# Altium schematic sheet 04_microSD.SchDoc
size A4; SheetNumber: 5; SheetTotal: 6
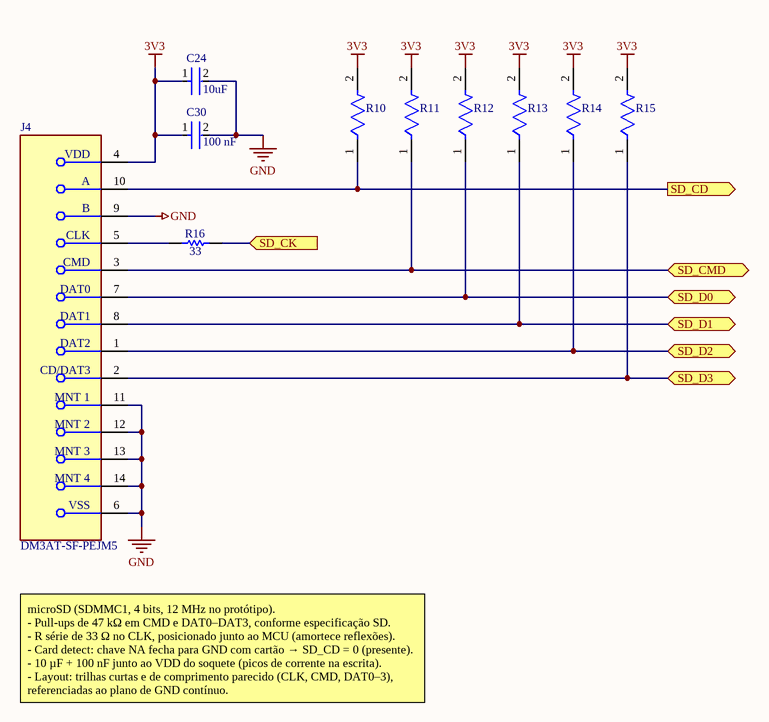
[diagram p0: 04_microSD.SchDoc]

## Parts
C24  value 10uF  [FP-GRM21B-0_2-e0_2_0_7-IPC_B]  (hidden comment: GRM21BZ71E106KE15K)
C30  Capacitance: 100 nF  [FP-CC0603-DA-MFG]  (hidden comment: CC0603KRX7R9BB104)
J4  DM3AT-SF-PEJM5  [FP-DM3AT-SF-PEJM5-MFG]
R10  RC0603FR-0747KL  [FP-RC0603FR-0747KL-MFG]  (value not drawn)
R11  RC0603FR-0747KL  [FP-RC0603FR-0747KL-MFG]  (value not drawn)
R12  RC0603FR-0747KL  [FP-RC0603FR-0747KL-MFG]  (value not drawn)
R13  RC0603FR-0747KL  [FP-RC0603FR-0747KL-MFG]  (value not drawn)
R14  RC0603FR-0747KL  [FP-RC0603FR-0747KL-MFG]  (value not drawn)
R15  RC0603FR-0747KL  [FP-RC0603FR-0747KL-MFG]  (value not drawn)
R16  Resistance: 33  [RESC1608X55X25LL10T15]  (hidden comment: RC0603FR-0733RL)

## Ports
SD_CD (out, see 00_Top[3B], 02_MCU[2B]), SD_CK (in, see 00_Top[3B], 02_MCU[3B]), SD_CMD (bidir, see 00_Top[3B], 02_MCU[3B]), SD_D0 (bidir, see 00_Top[3A], 02_MCU[3B]), SD_D1 (bidir, see 00_Top[3B], 02_MCU[3B]), SD_D2 (bidir, see 00_Top[3B], 02_MCU[3B]), SD_D3 (bidir, see 00_Top[3B], 02_MCU[3B])

## Nets
3V3: C24.1 C30.1 J4.4(VDD) R10.2 R11.2 R12.2 R13.2 R14.2 R15.2
GND: C24.2 C30.2 J4.6(VSS) J4.9(B) J4.11(MNT_1) J4.12(MNT_2) J4.13(MNT_3) J4.14(MNT_4)
SD_CD: J4.10(A) R10.1 ; port SD_CD
SD_CK: R16.2 ; port SD_CK
SD_CMD: J4.3(CMD) R11.1 ; port SD_CMD
SD_D0: J4.7(DAT0) R12.1 ; port SD_D0
SD_D1: J4.8(DAT1) R13.1 ; port SD_D1
SD_D2: J4.1(DAT2) R14.1 ; port SD_D2
SD_D3: J4.2(CD/DAT3) R15.1 ; port SD_D3
NetJ4_5: J4.5(CLK) R16.1

## Notes on the sheet
- microSD (SDMMC1, 4 bits, 12 MHz no protótipo).
  - Pull-ups de 47 kΩ em CMD e DAT0–DAT3, conforme especificação SD.
  - R série de 33 Ω no CLK, posicionado junto ao MCU (amortece reflexões).
  - Card detect: chave NA fecha para GND com cartão → SD_CD = 0 (presente).
  - 10 µF + 100 nF junto ao VDD do soquete (picos de corrente na escrita).
  - Layout: trilhas curtas e de comprimento parecido (CLK, CMD, DAT0–3), referenciadas ao plano de GND contínuo.

## Library data of the parts
C24 = CMP-06035-042430-1: Chip Multilayer Ceramic Capacitors for General Purpose, 0805, 10uF, X7R, 15%, 10%, 25V; Case/Package: 0805
C30 = CMP-2100-03601-2: CAP CER 0.1UF 50V X7R 0603; Manufacturer: YAGEO; Material: Ceramic; Temperature Coefficient: 15%; Tolerance: 0.1; Value: 100 nF; Height: 0.9mm; Voltage: 50 V; ComponentLink2Description: Datasheet; Device Class L2: Capacitors; Temperature Range High: +125°C; Category: Cap; Footprint Url: http://www.yageo.com/exep/pages/download/literatures/UPY-C_GEN_24.pdf; ComponentLink2URL: http://www.yageo.com/documents/recent/UPY-GPHC_X7R_6.3V-to-50V_18.pdf; Package: CC0603-DA; Temperature: -55°C to +125°C; Voltage Rating: 50 V; Temperature Characteristic: X7R; Device Class L1: Passive Components; Temperature Range Low: -55°C; Manufacturer Part Number: CC0603KRX7R9BB104; RoHS: TRUE; Automotive: No; Device Class L3: Ceramic Capacitors; Octopart: https://octopart.com/cc0603krx7r9bb104-yageo-42244635; Mouser Description: Multilayer Ceramic Capacitor, CC Series, 0.1 - F, - 10%, X7R, 50 V, 0603 [1608 Metric]; Lead Free: Yes; Digikey Description: CAP CER 0.1UF 50V X7R 0603
J4 = CMP-2000-05150-2: CONN MICRO SD CARD PUSH-PUSH R/A; Current Rating: 500mA; Number of Contacts: 8; Pitch: 1.1mm; Gender: Female; Connector Type: Connector; Max Voltage Rating (AC): 125V; Min Operating Temperature: -25°C; Length: 15.95mm; Packaging: Tape and Reel; Width: 13.85mm; Flammability Rating: UL94 V-0; Termination: SMD/SMT; Contact Material: Copper Alloy; Depth: 15.95mm; Radiation Hardening: No; Number of Rows: 1; Max Operating Temperature: 85°C; Housing Material: Polymer; Height: 1.68mm; Package Quantity: 1; Orientation: Right Angle; REACH SVHC: No SVHC; Mount: Surface Mount; Max Current Rating: 500mA; Number of Positions: 8; Lead Free: Lead Free; Contact Plating: Gold; Voltage Rating: 125V
R10-R15 = CMP-1659-00055-2: RES SMD 47K OHM 1% 1/10W 0603; Voltage Rating: 50V; Temperature Coefficient: 100ppm/°C; Max Power Dissipation: 100mW; Resistance: 47kR; Voltage Rating (DC): 50V; Min Operating Temperature: -55°C; Packaging: Tape and Reel; Features: Moisture Resistant; Termination: SMD/SMT; Technology: THICK FILM; Lead Free: Lead Free; Max Operating Temperature: 155°C; Width: 0.031inch; Case Code (Metric): 1608; Tolerance: 1%; Package Quantity: 1; Resistor Type: Thick Film; RoHS Compliant: Yes; Case/Package: 0603; Case Code (Imperial): 0603; Resistance Tolerance: 1%; Length: 0.063inch; Series: RC; Number of Pins: 2; Power Rating: 100mW; Number of Terminations: 2; Construction: Rectangular; Height: 0.022inch; Military Standard: Not; Size Code: 0603; Depth: 0.8mm
R16 = CMP-2000-06939-1: Chip Resistor, 33 Ohm, +/- 1%, 0.1 W, -55 to 155 degC, 0603 (1608 Metric), RoHS, Tape and Reel; Temperature Coefficient: 100PPM/C; Voltage Rating: 75V; Unit Weight: 0.000071oz; Power Rating: 100mW; Brand: Yageo; Product Category: ThickFilmResistors; Packaging: Reel; Tolerance: 1%; RoHS: True; Height: 0.45mm; Case Code - mm: 1608; Series: RC; Datasheet URL: http://www.yageo.com/documents/recent/PYu-RC_Group_51_RoHS_L_7.pdf; Operating Temperature Range: -55Cto+155C; Type: GeneralPurposeChipResistorSurfaceMount; Product: ThickFilmResistorsGeneralPurpose; Package / Case: 0603(1608metric); Width: 0.8mm; Length: 1.6mm; Case Code - in: 0603; Mounting Technology: SurfaceMount; Manufacturer URL: http://www.yageo.com/; Manufacturer: Yageo; Package Reference: 0603; Termination Style: SMD/SMT; Datasheet Version: Rev. 7, 05/2017; Package Description: 2-Pin Surface Mount Device, Body 1.6 x 0.8 mm